# Altium schematic sheet HMS.SIM.A7682S.SchDoc: HMS.SIM.A7682S
size A4
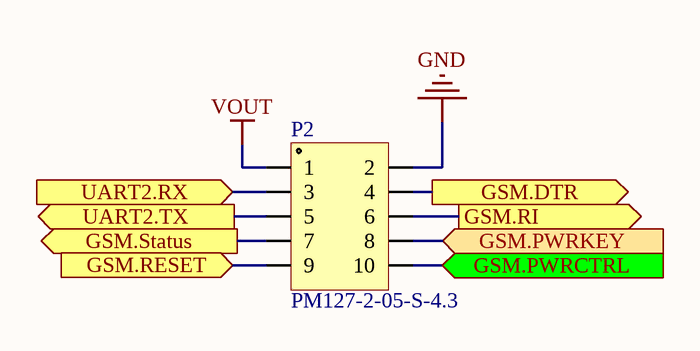
[diagram p0: HMS.SIM.A7682S.SchDoc]

## Parts
P2  PM127-2-05-S-4.3  [Female 127-2-05-s4.3]

## Ports
GSM.DTR (out), GSM.PWRCTRL (in), GSM.PWRKEY (in), GSM.RESET (in), GSM.RI (out), GSM.Status (out), UART2.RX (in), UART2.TX (out)

## Nets
GND: P2.2
VOUT: P2.1
GSM.DTR: P2.4 ; port GSM.DTR
GSM.PWRCTRL: P2.10 ; port GSM.PWRCTRL
GSM.PWRKEY: P2.8 ; port GSM.PWRKEY
GSM.RESET: P2.9 ; port GSM.RESET
GSM.RI: P2.6 ; port GSM.RI
GSM.Status: P2.7 ; port GSM.Status
UART2.RX: P2.3 ; port UART2.RX
UART2.TX: P2.5 ; port UART2.TX

## Notes on the sheet
- Title
- Size:
- Date:
- A4
- Number:
- Time:
- Revision:
- Sheet
- of
- File:

## Library data of the parts
P2 = PM127-2-05-S-4.3: 1.27MM 2*5pin SMD Female Header Plastic Height4.3MM; Manufacturer: HCTL; Connector Type: Forked, Receptacle; Current Rating: 2A; Dielectric Material: Polyamide; Insulation Resistance: 5GΩ; Number of Contacts: 5; Number of Positions: 10; Supplier 1: Mouser; Manufacturer Part Number: PM127-2-05-S-4.3; RoHS: Compliant; Category: Card Edge Connectors; Stock 1: 1610; Pricing 1: 1=2, 10=1.79, 50=1.79, 100=1.7, 1000=1.22, 10000=1.18 (USD); China RoHS: Compliant; Color: Black; Contact Gender: Female; Contact Plating: Tin; Depth: 1.27mm; Export Control Classification Number (ECCN) Code: EAR99; Gender: Female; Height: 8.26mm; Housing Color: Black; Harmonized Tariff Schedule (HTS) Code: 8536.69.40.40; Insulation Color: Black; Introduction Date: 2007-03-15; Lead Free: Lead Free; Lifecycle Status: Production; Max Current Rating: 2A; Max Operating Temperature: 105°C; Min Operating Temperature: -40°C; Mount: Through Hole; Number of Rows: 2; Orientation: Straight; Packaging: Bulk; Pitch: 1.27mm; REACH SVHC: Unaffected; Terminal Pitch: 1.27mm; Termination: Solder; Width: 2.54mm; ComponentLink1URL: https://datasheet.octopart.com:443/929974-01-10-RK-3M-datasheet-24569739.pdf?src-supplier=IHS; ComponentLink1Description: https://datasheet.octopart.com:443/929974-01-10-RK-3M-datasheet-24569739.pdf?src-supplier=IHS; ComponentLink2URL: https://datasheet.octopart.com:443/80000909525-3M-datasheet-5391050.pdf?src-supplier=Arrow+Electronics; ComponentLink2Description: https://datasheet.octopart.com:443/80000909525-3M-datasheet-5391050.pdf?src-supplier=Arrow+Electronics; ComponentLink3URL: http://sigma.octopart.com:80/conflict_mineral_statement/3M-company-24.pdf?src-supplier=Compliance+Statements; ComponentLink3Description: http://sigma.octopart.com:80/conflict_mineral_statement/3M-company-24.pdf?src-supplier=Compliance+Statements; MPN: PM127-2-05-S-4.3; Value: PM127-2-05-S-4.3